# Altium schematic sheet USB PD.SchDoc
size A; SheetNumber: 3; SheetTotal: 6
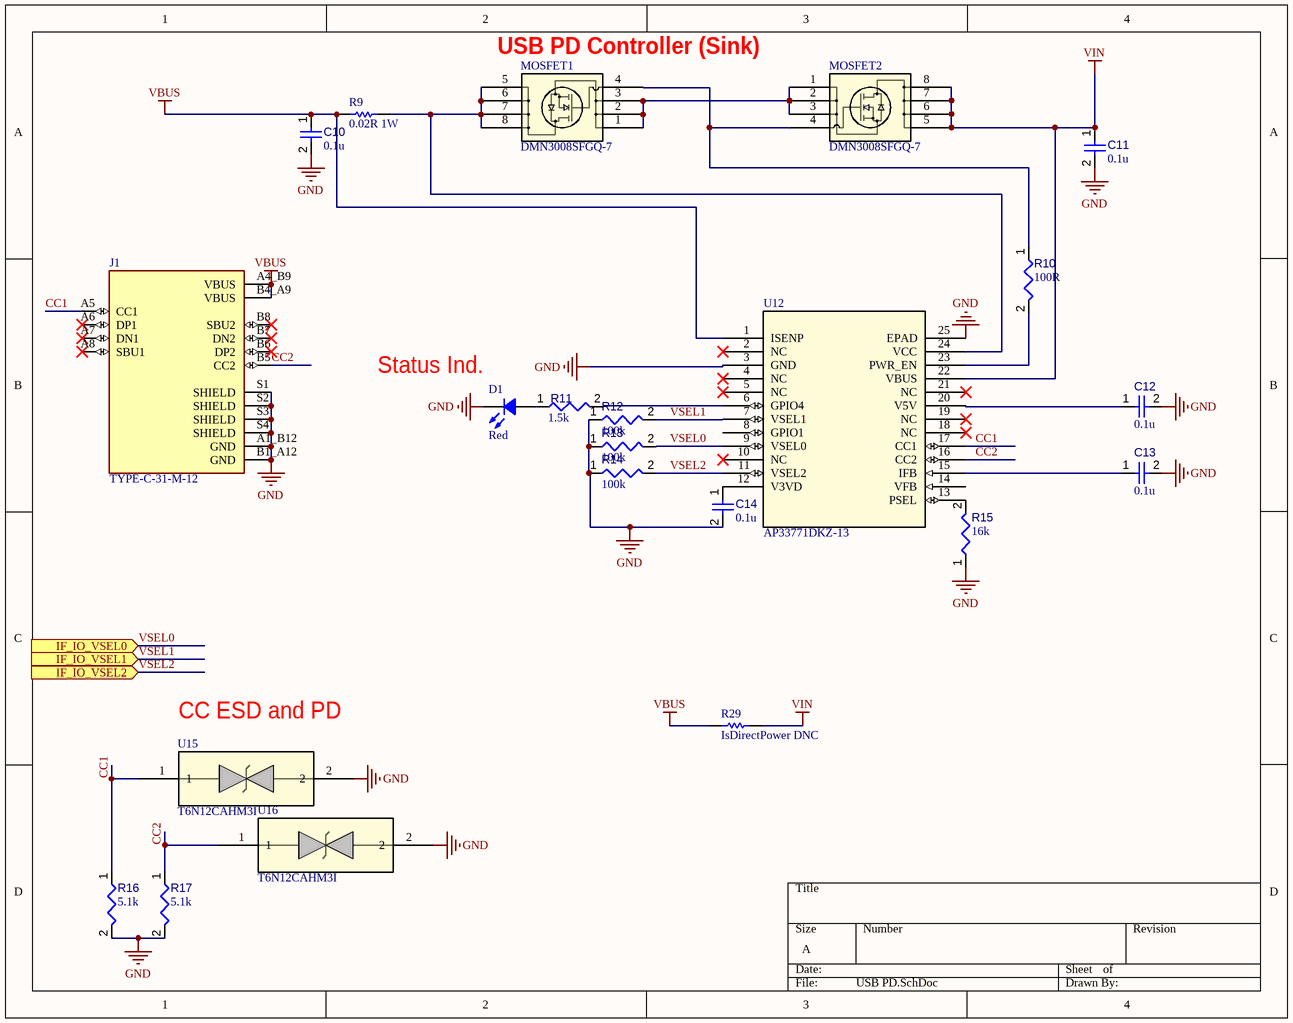
[diagram p0: USB PD.SchDoc]

## Parts
C10  value 0.1u  [CAPC0402(1005)60_L]  (hidden comment: Capacitor 10µF +/-40% 6.3V 0402)
C11  value 0.1u  [CAPC0402(1005)60_L]  (hidden comment: Capacitor 10µF +/-40% 6.3V 0402)
C12  value 0.1u  [CAPC0402(1005)60_L]  (hidden comment: Capacitor 10µF +/-40% 6.3V 0402)
C13  value 0.1u  [CAPC0402(1005)60_L]  (hidden comment: Capacitor 10µF +/-40% 6.3V 0402)
C14  value 0.1u  [CAPC0402(1005)60_L]  (hidden comment: Capacitor 10µF +/-40% 6.3V 0402)
D1  Red  [LED 0402_1005 YELLOW]
J1  TYPE-C-31-M-12  [HRO_TYPE-C-31-M-12]
MOSFET1  DMN3008SFGQ-7  [PowerDI3333-8_DIO]
MOSFET2  DMN3008SFGQ-7  [PowerDI3333-8_DIO]
R9  0.02R 1W  [RESC3225X70X50NL20T20]
R10  value 100R  [RESC1005X40X25ML05T05]  (hidden comment: Resistor 10k +/-1% 0402 63 mW)
R11  value 1.5k  [RESC1005X40X25ML05T05]  (hidden comment: Resistor 10k +/-1% 0402 63 mW)
R12  value 100k  [RESC1005X40X25ML05T05]  (hidden comment: Resistor 10k +/-1% 0402 63 mW)
R13  value 100k  [RESC1005X40X25ML05T05]  (hidden comment: Resistor 10k +/-1% 0402 63 mW)
R14  value 100k  [RESC1005X40X25ML05T05]  (hidden comment: Resistor 10k +/-1% 0402 63 mW)
R15  value 16k  [RESC1005X40X25ML05T05]  (hidden comment: Resistor 10k +/-1% 0402 63 mW)
R16  value 5.1k  [RESC1005X40X25ML05T05]  (hidden comment: Resistor 10k +/-1% 0402 63 mW)
R17  value 5.1k  [RESC1005X40X25ML05T05]  (hidden comment: Resistor 10k +/-1% 0402 63 mW)
R29  IsDirectPower DNC  [RESC3225X70X50NL20T20]
U12  AP33771DKZ-13  [QFN24_W-QFN4040-24_A1_DIO]
U15  T6N12CAHM3I  [DFN3820A-2_VIS]
U16  T6N12CAHM3I  [DFN3820A-2_VIS]

## Ports
IF_IO_VSEL0 (in), IF_IO_VSEL1 (in), IF_IO_VSEL2 (in)

## Nets
GND: C10.2 C11.2 C12.2 C13.2 C14.2 D1.2 J1.A1_B12(GND) J1.B1_A12(GND) J1.S1(SHIELD) J1.S2(SHIELD) J1.S3(SHIELD) J1.S4(SHIELD) R12.1 R13.1 R14.1 R15.1 R16.2 R17.2 U12.3(GND) U12.25(EPAD) U15.2 U16.2
VBUS: C10.1 J1.A4_B9(VBUS) J1.B4_A9(VBUS) R9.2 R29.2 U12.1(ISENP)
VIN: C11.1 MOSFET2.5 MOSFET2.6 MOSFET2.7 MOSFET2.8 R29.1 U12.22(VBUS)
CC1: J1.A5(CC1) R16.1 U12.17(CC1) U15.1
CC2: J1.B5(CC2) R17.1 U12.16(CC2) U16.1
VSEL0: R13.2 U12.9(VSEL0) ; port IF_IO_VSEL0
VSEL1: R12.2 U12.7(VSEL1) ; port IF_IO_VSEL1
VSEL2: R14.2 U12.11(VSEL2) ; port IF_IO_VSEL2
NetC12_1: C12.1 U12.20(V5V)
NetC13_1: C13.1 U12.15(IFB)
NetC14_1: C14.1 U12.12(V3VD)
NetD1_1: D1.1 R11.1
NetMOSFET1_1: MOSFET1.1 MOSFET1.2 MOSFET1.3 MOSFET2.1 MOSFET2.2 MOSFET2.3
NetMOSFET1_4: MOSFET1.4 MOSFET2.4 R10.1
NetMOSFET1_5: MOSFET1.5 MOSFET1.6 MOSFET1.7 MOSFET1.8 R9.1 U12.24(VCC)
NetR10_2: R10.2 U12.23(PWR_EN)
NetR11_2: R11.2 U12.6(GPIO4)
NetR15_2: R15.2 U12.13(PSEL)

Not connected (* = marked no-connect by the designer): J1 A6(DP1)* A7(DN1)* A8(SBU1)* B6(DP2)* B7(DN2)* B8(SBU2)*; U12 2(NC)* 4(NC)* 5(NC)* 8(GPIO1) 10(NC)* 14(VFB) 18(NC)* 19(NC)* 21(NC)*

## Notes on the sheet
- (near MOSFET1) USB PD Controller (Sink)
- (near D1) Status Ind.
- (near U15) CC ESD and PD

## Library data of the parts
C10-C14 = CMP-001-00074-3: Chip Capacitor, 0.1µF +/-40%, 6.3V, 0402, Thickness 0.6 mm; Tolerance: 10%; Case/Package: 0402; Pins: 2; Mounting Technology: SMT; Voltage Rating: 6.3V; Max Operating Temperature: 85°C; Min Operating Temperature: -55°C
D1 = BL-HKC37A-AV-TRB: 0402 RED; Manufacturer: American Bright Optoelectronics Corporation; Color: Yellow; Configuration: Standard; Current - Test: 20mA; Lens Color: Colorless; Lens Style: Rectangle with Flat Top; Lens Transparency: Clear; Millicandela Rating: 120mcd; Viewing Angle: 120°; Voltage - Forward (Vf) (Typ): 2.2V; Wavelength - Dominant: 589nm; Wavelength - Peak: 590nm; Part Number: BL-HKC37A-AV-TRB; ComponentLink1Description: Datasheet; ComponentLink1URL: https://americanbrightled.com/pdffiles/smt/BL-HKC37A-AV-TRB.pdf; ComponentLink2Description: DigiKey Link; ComponentLink2URL: https://www.digikey.com/en/products/detail/american-bright-optoelectronics-corporation/BL-HKC37A-AV-TRB/9678171; Device Package: 0402 (1005 Metric); Height (Max): 0.45mm; LastUpdated: 11/9/2022 10:29:51 am; Lifecycle Status: Active; Minimum Order: 1; Mounting Type: Surface Mount; Package / Case: 0402 (1005 Metric); Packaging: TapeAndReel; PartId: 1041; Part Status: Active; Price: 0.06; Series: -; Size / Dimension: 1.00mm L x 0.50mm W; Supplier 1: DigiKey; Supplier Part Number 1: BL-HKC37A-AV-TRBCT-ND; Supplier Device Package: 0402; Value: Red
J1 = TYPE-C-31-M-12: USB Connectors 24 Receptacle 1 8.94*7.3mm RoHS; MF: HRO Electronics Co., Ltd.; SnapEDA_Link: https://www.snapeda.com/parts/TYPE-C-31-M-12/HRO+Electronics+Co.%252C+Ltd./view-part/?ref=snap; Package: Package; Value: *; MP: TYPE-C-31-M-12; Check_prices: https://www.snapeda.com/parts/TYPE-C-31-M-12/HRO+Electronics+Co.%252C+Ltd./view-part/?ref=eda
MOSFET1 MOSFET2 = DMN3008SFGQ-7: No Description Available; Mfr_Name: Diodes Inc; RefDes: RefDes; Type: Type
R9 R29 = CMP-2005-03839-2: Part Number: ERJ-L14KF20MU; Manufacturer: Panasonic
R10 R12-R17 = CMP-009-00019-5: Chip Resistor, 12 KOhm, +/- 1%, 63 mW, -55 to 155 degC, 0402 (1005 Metric); Power: 63mW; Voltage Rating: 50V; Case/Package: 0402; Mounting Technology: SM; Pins: 2; Min Operating Temperature: -55°C; Tolerance: 1%; RoHS Compliant: True; Max Operating Temperature: 155°C
R11 = CMP-009-00019-5: Chip Resistor, 1.5 KOhm, +/- 1%, 63 mW, -55 to 155 degC, 0402 (1005 Metric); Power: 63mW; Voltage Rating: 50V; Case/Package: 0402; Mounting Technology: SM; Pins: 2; Min Operating Temperature: -55°C; Tolerance: 1%; RoHS Compliant: True; Max Operating Temperature: 155°C
U12 = AP33771DKZ-13: No Description Available; Mfr_Name: Diodes Inc; RefDes: RefDes; Type: Type
U15 U16 = T6N12CAHM3I: No Description Available; Mfr_Name: Vishay; RefDes: RefDes; Type: Type